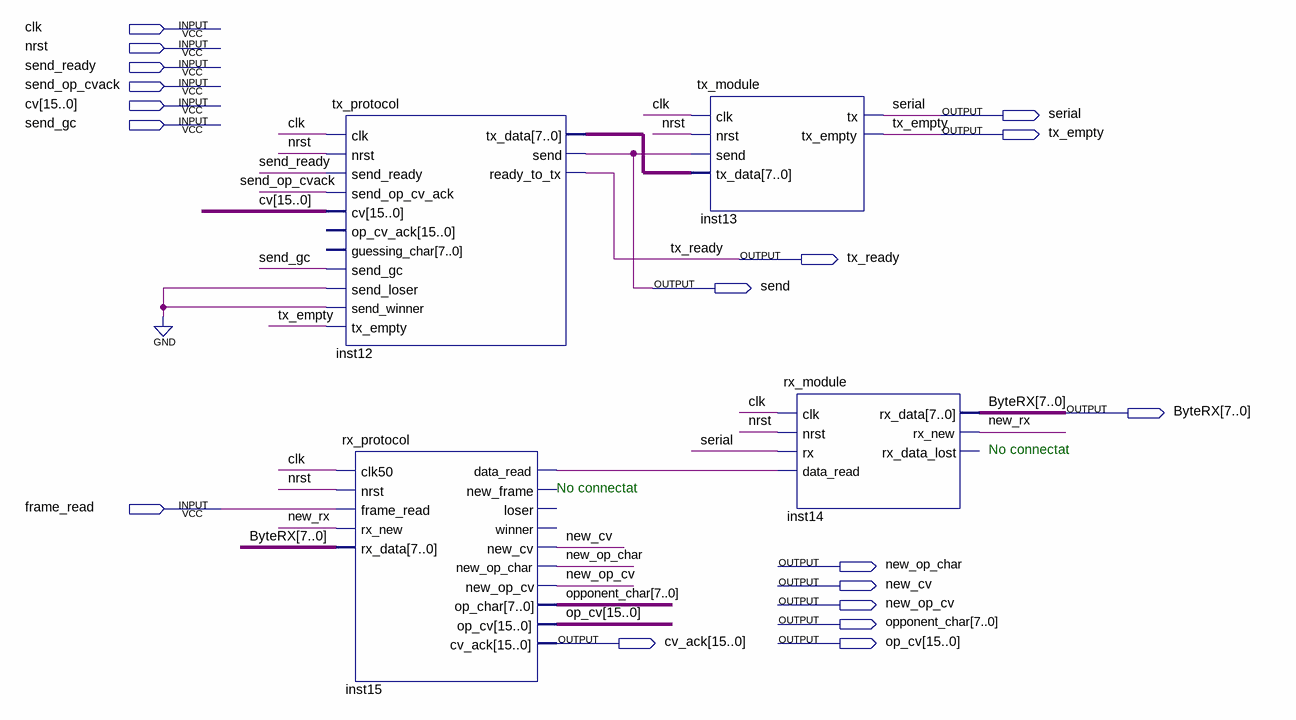
[diagram p0: schematic sheet]
// Quartus schematic tx_rx_test.bdf as structural Verilog: 4 symbols, 18 pins
module tx_rx_test (
  input  clk,
  input  nrst,
  input  send_ready,
  input  send_op_cvack,
  input  [15:0] cv,
  input  send_gc,
  input  frame_read,
  output serial,
  output tx_empty,
  output tx_ready,
  output send,
  output [7:0] ByteRX,
  output new_op_char,
  output new_cv,
  output new_op_cv,
  output [7:0] opponent_char,
  output [15:0] cv_ack,
  output [15:0] op_cv
);

  wire inst15_data_read, new_rx;
  wire [7:0] inst12_tx_data;

  tx_protocol inst12 (
    .clk(clk), .nrst(nrst), .send_ready(send_ready), .send_op_cv_ack(send_op_cvack), .cv(cv),
    .send_gc(send_gc), .send_loser(1'b0), .send_winner(1'b0), .tx_empty(tx_empty), .tx_data(inst12_tx_data),
    .send(send), .ready_to_tx(tx_ready));  // open: op_cv_ack, guessing_char
  rx_protocol inst15 (
    .clk50(clk), .nrst(nrst), .frame_read(frame_read), .rx_new(new_rx), .rx_data(ByteRX),
    .data_read(inst15_data_read), .new_cv(new_cv), .new_op_char(new_op_char), .new_op_cv(new_op_cv),
    .op_char(opponent_char), .op_cv(op_cv), .cv_ack(cv_ack));  // open: new_frame, loser, winner
  tx_module inst13 (.clk(clk), .nrst(nrst), .send(send), .tx_data(inst12_tx_data), .tx(serial), .tx_empty(tx_empty));
  rx_module inst14 (
    .clk(clk), .nrst(nrst), .rx(serial), .data_read(inst15_data_read), .rx_data(ByteRX), .rx_new(new_rx));  // open: rx_data_lost

  // Notes on the sheet:
  //   No connectat
  //   No connectat
endmodule
